# Altium project TIE_2023.PrjPcb
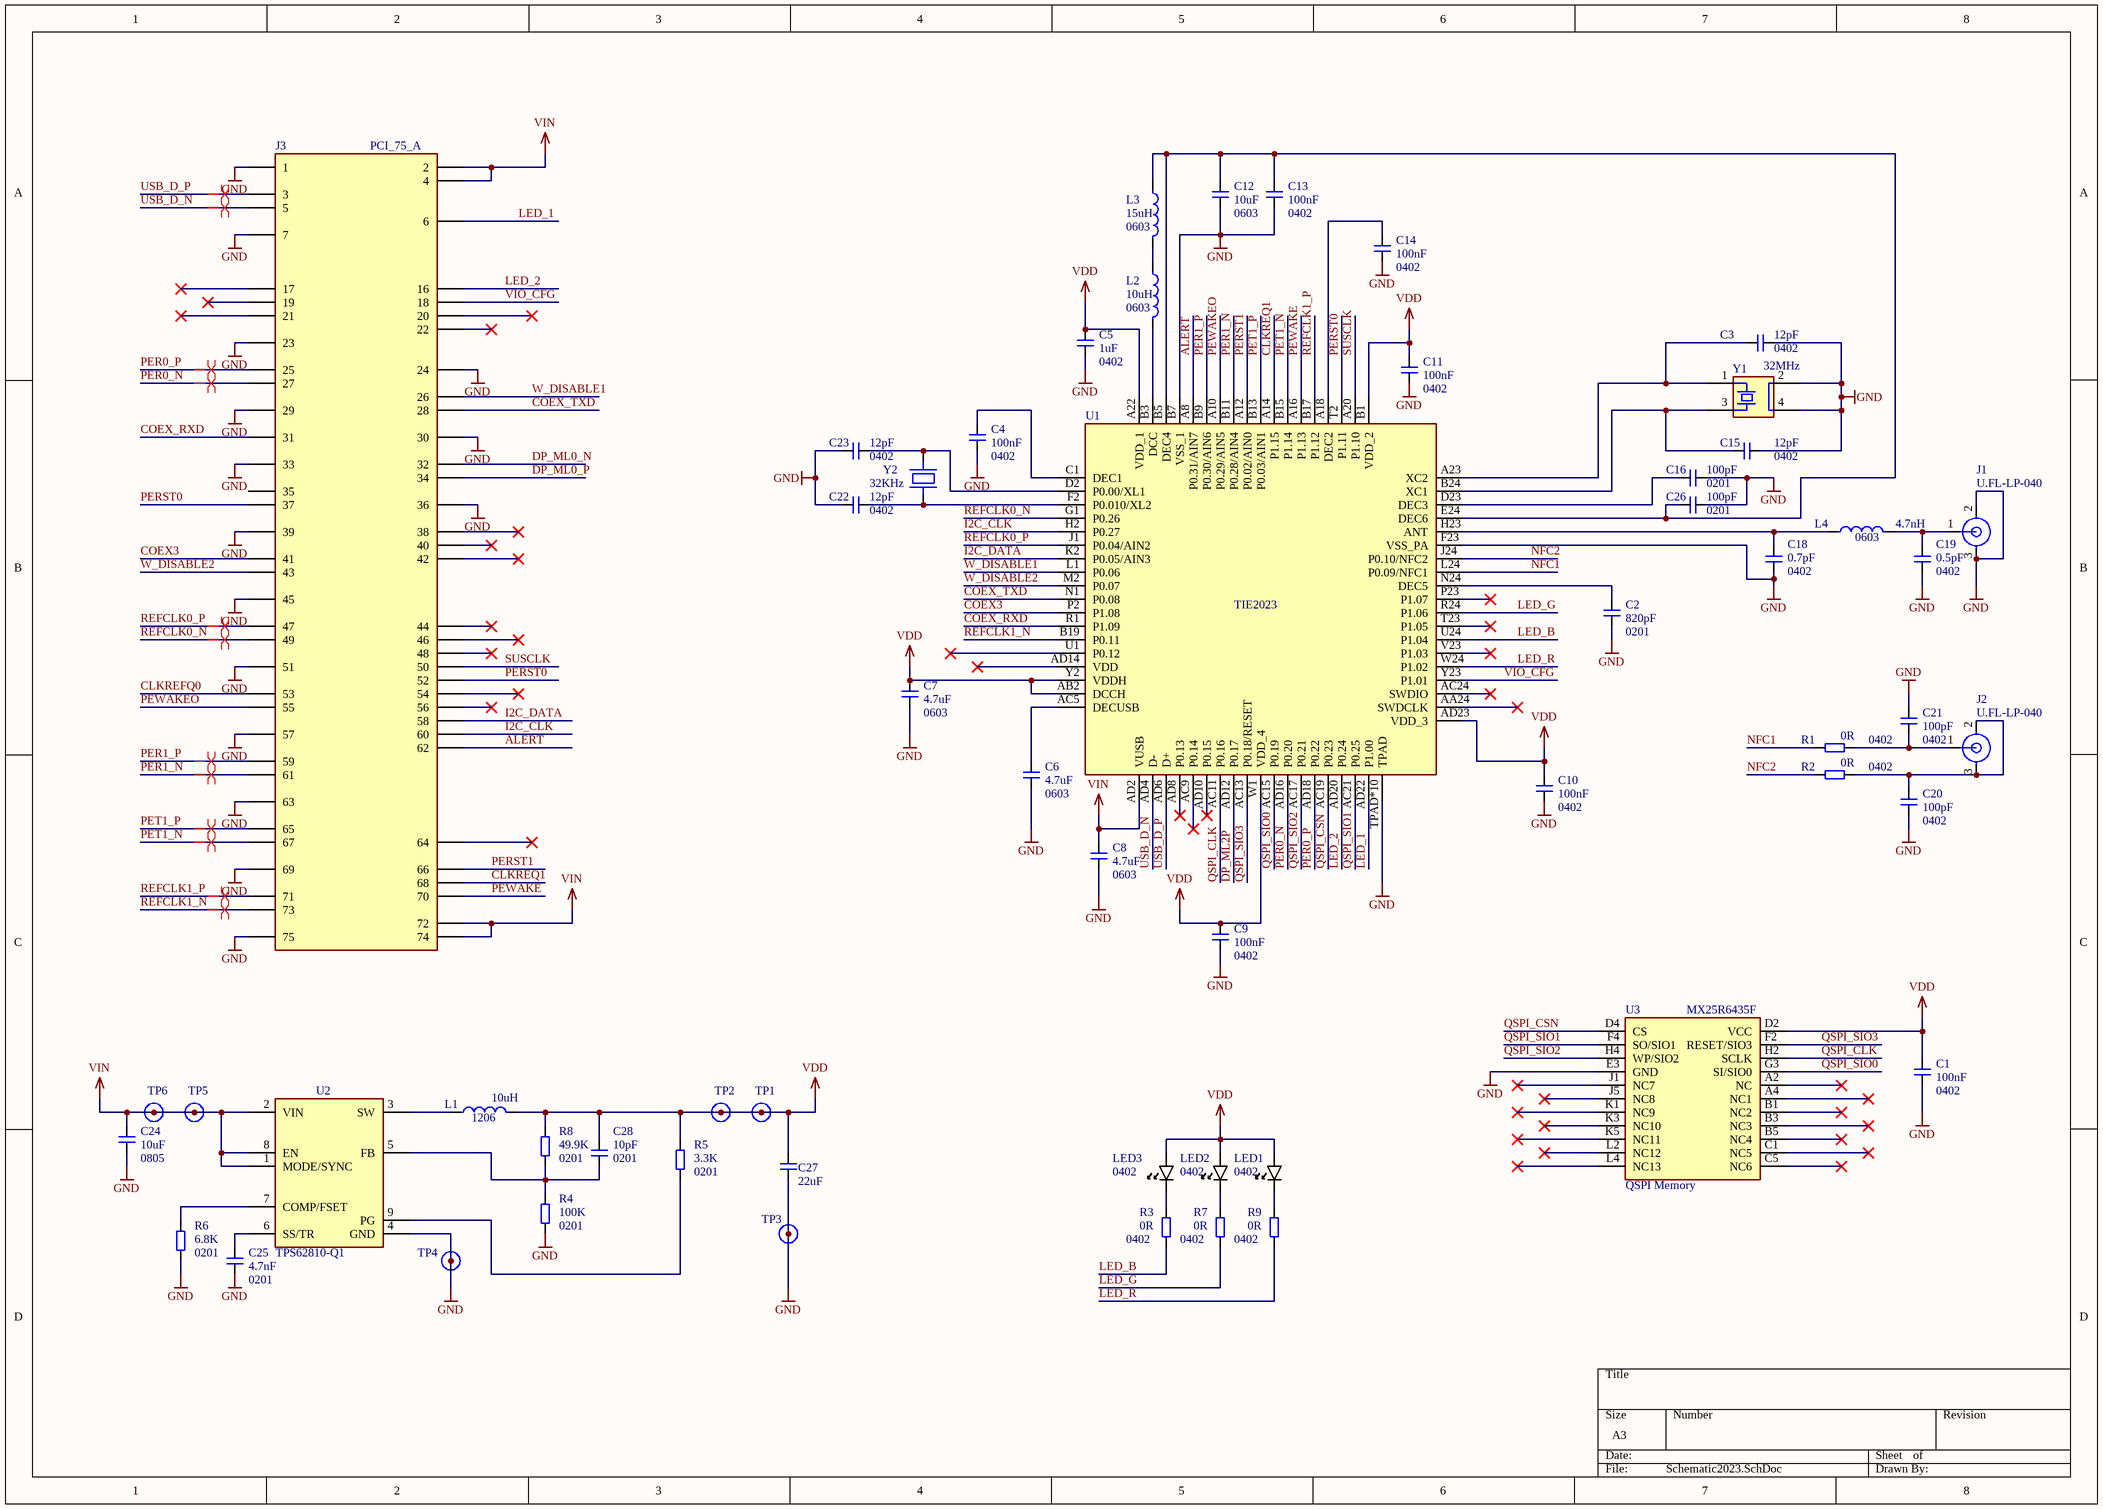
[diagram p0: Schematic2023.SchDoc]
1 sheet, 57 parts. Net scope: global (net labels, ports and power ports of the same name join across sheets).
Board file: PCB_2023.PcbDoc

## Sheet Schematic2023.SchDoc
size A3; SheetNumber: 1; SheetTotal: 1

### Parts
C1  100nF  Package: 0402  [CAP0402]
C2  820pF  Package: 0201  [CAP0201]
C3  12pF  PAckage: 0402  [CAP0402]
C4  100nF  Package: 0402  [CAP0402]
C5  1uF  Package: 0402  [CAP0402]
C6  4.7uF  Package: 0603  [CAP0603]
C7  4.7uF  Package: 0603  [CAP0603]
C8  4.7uF  Package: 0603  [CAP0603]
C9  100nF  Package: 0402  [CAP0402]
C10  100nF  Package: 0402  [CAP0402]
C11  100nF  Package: 0402  [CAP0402]
C12  10uF  Package: 0603  [CAP0603]
C13  100nF  Package: 0402  [CAP0402]
C14  100nF  Package: 0402  [CAP0402]
C15  12pF  Package: 0402  [CAP0402]
C16  100pF  Package: 0201  [CAP0201]
C18  0.7pF  Package: 0402  [CAP0402]
C19  0.5pF  Package: 0402  [CAP0402]
C20  100pF  Package: 0402  [CAP0402]
C21  100pF  Package: 0402  [CAP0402]
C22  12pF  PAckage: 0402  [CAP0402]
C23  12pF  PAckage: 0402  [CAP0402]
C24  10uF  Package: 0805  [CAP0805]
C25  4.7nF  Package: 0201  [CAP0201]
C26  100pF  Package: 0201  [CAP0201]
C27  22uF  [CAP0805]
C28  10pF  PAckage: 0201  [CAP0201]
J1  U.FL-LP-040  [U.FL-R-SMT-1]
J2  U.FL-LP-040  [U.FL-R-SMT-1]
J3  PCI_75_A  [PCI_75_a]  (no BOM)
L1  10uH  Package: 1206  [FB_1206]
L2  10uH  Package: 0603  [FB_0603]
L3  15uH  Package: 0603  [FB_0603]
L4  4.7nH  Package: 0603  [FB_0603]
LED1  Parameter 1: 0402  [LED0402]  (hidden comment: APT1608SRCPRV)
LED2  Parameter 1: 0402  [LED0402]  (hidden comment: APT1608SRCPRV)
LED3  Parameter 1: 0402  [LED0402]  (hidden comment: APT1608SRCPRV)
R1  0R  Package: 0402  [RES0402]
R2  0R  Package: 0402  [RES0402]
R3  0R  Package: 0402  [RES0402]
R4  100K  Package: 0201  [RES0201]
R5  3.3K  PAckage: 0201  [RES0201]
R6  6.8K  Package: 0201  [RES0201]
R7  0R  Package: 0402  [RES0402]
R8  49.9K  Package: 0201  [RES0201]
R9  0R  Package: 0402  [RES0402]
TP1  Testpoint  [TestPoint]  (value not drawn)  (no BOM)
TP2  Testpoint  [TestPoint]  (value not drawn)  (no BOM)
TP3  Testpoint  [TestPoint]  (value not drawn)  (no BOM)
TP4  Testpoint  [TestPoint]  (value not drawn)  (no BOM)
TP5  Testpoint  [TestPoint]  (value not drawn)  (no BOM)
TP6  Testpoint  [TestPoint]  (value not drawn)  (no BOM)
U1  TIE2023  [TIE23_IC]
U2  TPS62810-Q1  [VQFN-9]
U3  QSPI Memory  [WLCSP-22]
Y1  32MHz  [XRCGB-2X1.6]
Y2  32KHz  [CFPX-3.2X1.5]

### Nets
GND: C1.1 C2.1 C3.2 C4.1 C5.1 C6.1 C7.1 C8.1 C9.1 C10.1 C11.1 C12.1 C13.1 C14.1 C15.2 C16.2 C18.1 C19.1 C20.1 C21.2 C22.1 C23.1 C24.1 C25.1 C26.2 C27.1 J1.2 J1.3 J3.1 J3.7 J3.23 J3.24 J3.29 J3.30 J3.33 J3.36 J3.39 J3.45 J3.51 J3.57 J3.63 J3.69 J3.75 R4.1 R6.1 TP3.1 TP4.1 U1.B7(VSS_1) U1.F23(VSS_PA) U1.TPAD*10(TPAD) U2.4(GND) U3.E3(GND) Y1.2 Y1.4
VDD: C1.2 C5.2 C7.2 C9.2 C10.2 C11.2 C27.2 C28.2 L1.2 LED1.2 LED2.2 LED3.2 R5.2 R8.2 TP1.1 TP2.1 U1.A22(VDD_1) U1.AB2(DCCH) U1.AD23(VDD_3) U1.B1(VDD_2) U1.W1(VDD_4) U1.Y2(VDDH) U3.D2(VCC)
VIN: C8.2 C24.2 J3.2 J3.4 J3.72 J3.74 TP5.1 TP6.1 U1.AD2(VUSB) U2.1(MODE/SYNC) U2.2(VIN) U2.8(EN)
ALERT: J3.62 U1.A8(P0.31/AIN7)
CLKREFQ0: J3.53
CLKREQ1: J3.68 U1.A14(P1.15)
COEX3: J3.41 U1.P2(P1.08)
COEX_RXD: J3.31 U1.R1(P1.09)
COEX_TXD: J3.28 U1.N1(P0.08)
DP_ML0_N: J3.32
DP_ML0_P: J3.34
DP_ML2P: U1.AD12(P0.17)
I2C_CLK: J3.60 U1.H2(P0.27)
I2C_DATA: J3.58 U1.K2(P0.05/AIN3)
LED_1: J3.6 U1.AD22(P1.00)
LED_2: J3.16 U1.AD20(P0.24)
LED_B: R3.1 U1.U24(P1.04)
LED_G: R7.1 U1.R24(P1.06)
LED_R: R9.1 U1.W24(P1.02)
NFC1: R1.1 U1.L24(P0.09/NFC1)
NFC2: R2.1 U1.J24(P0.10/NFC2)
PER0_N: J3.27 U1.AD16(P0.20)
PER0_P: J3.25 U1.AD18(P0.22)
PER1_N: J3.61 U1.B11(P0.28/AIN4)
PER1_P: J3.59 U1.B9(P0.30/AIN6)
PERST0: J3.37 J3.52 U1.T2(P1.11)
PERST1: J3.66 U1.A12(P0.02/AIN0)
PET1_N: J3.67 U1.B15(P1.14)
PET1_P: J3.65 U1.B13(P0.03/AIN1)
PEWAKE: J3.70 U1.A16(P1.13)
PEWAKEO: J3.55 U1.A10(P0.29/AIN5)
QSPI_CLK: U1.AC11(P0.16) U3.H2(SCLK)
QSPI_CSN: U1.AC19(P0.23) U3.D4(CS)
QSPI_SIO0: U1.AC15(P0.19) U3.G3(SI/SIO0)
QSPI_SIO1: U1.AC21(P0.25) U3.F4(SO/SIO1)
QSPI_SIO2: U1.AC17(P0.21) U3.H4(WP/SIO2)
QSPI_SIO3: U1.AC13(P0.18/RESET) U3.F2(RESET/SIO3)
REFCLK0_N: J3.49 U1.G1(P0.26)
REFCLK0_P: J3.47 U1.J1(P0.04/AIN2)
REFCLK1_N: J3.73 U1.B19(P0.11)
REFCLK1_P: J3.71 U1.B17(P1.12)
SUSCLK: J3.50 U1.A20(P1.10)
USB_D_N: J3.5 U1.AD4(D-)
USB_D_P: J3.3 U1.AD6(D+)
VIO_CFG: J3.18 U1.Y23(P1.01)
W_DISABLE1: J3.26 U1.L1(P0.06)
W_DISABLE2: J3.43 U1.M2(P0.07)
NetC2_2: C2.2 U1.N24(DEC5)
NetC3_1: C3.1 U1.A23(XC2) Y1.1
NetC4_2: C4.2 U1.C1(DEC1)
NetC6_2: C6.2 U1.AC5(DECUSB)
NetC12_2: C12.2 C13.2 C26.1 L3.1 U1.B5(DEC4) U1.E24(DEC6)
NetC14_2: C14.2 U1.A18(DEC2)
NetC15_1: C15.1 U1.B24(XC1) Y1.3
NetC16_1: C16.1 U1.D23(DEC3)
NetC18_2: C18.2 L4.1 U1.H23(ANT)
NetC19_2: C19.2 J1.1 L4.2
NetC20_2: C20.2 J2.2 J2.3 R2.2
NetC21_1: C21.1 J2.1 R1.2
NetC22_2: C22.2 U1.F2(P0.010/XL2) Y2.1
NetC23_2: C23.2 U1.D2(P0.00/XL1) Y2.2
NetC25_2: C25.2 U2.6(SS/TR)
NetC28_1: C28.1 R4.2 R8.1 U2.5(FB)
NetL1_1: L1.1 U2.3(SW)
NetL2_1: L2.1 L3.2
NetL2_2: L2.2 U1.B3(DCC)
NetLED1_1: LED1.1 R9.2
NetLED2_1: LED2.1 R7.2
NetLED3_1: LED3.1 R3.2
NetR5_1: R5.1 U2.9(PG)
NetR6_2: R6.2 U2.7(COMP/FSET)

Not connected (* = marked no-connect by the designer): J3 17* 19* 20* 21* 22* 35 38* 40* 42* 44* 46* 48* 54* 56* 64*; U1 AA24(SWDCLK)* AC9(P0.14)* AC24(SWDIO)* AD8(P0.13)* AD10(P0.15)* AD14(VDD)* P23(P1.07)* T23(P1.05)* U1(P0.12)* V23(P1.03)*; U3 A2(NC)* A4(NC1)* B1(NC2)* B3(NC3)* B5(NC4)* C1(NC5)* C5(NC6)* J1(NC7)* J5(NC8)* K1(NC9)* K3(NC10)* K5(NC11)* L2(NC12)* L4(NC13)*

### Layout directives
differential pair: PER0_N, PER0_P, PER1_N, PER1_P, PET1_N, PET1_P, REFCLK0_N, REFCLK0_P, REFCLK1_N, REFCLK1_P, USB_D_N, USB_D_P

### Library data of the parts
C1 C4 C9-C11 C13 C14 = GCM155R71C224KE02J: CAP CER 100nF 16V X7R 0402; Manufacturer: Murata; Manufacturer Part Number: GCM155R71C224KE02J
C2 = GRM033C81A473ME05D_1: CAP CER 820pF 20% 10V X6S 0201; Manufacturer: Murata; .Checked_PCB: AI; Manufacturer Part Number: GRM033C81A473ME05D; .Checked_SCH: AI; .Creator: AI
C3 C15 C22 C23 = GCM155R71C224KE02J_1: CAP CER 12pF 16V X7R 0402; Manufacturer: Murata; Manufacturer Part Number: GCM155R71C224KE02J
C5 = GCM155R71C224KE02J_1uF: CAP CER 1uF 16V X7R 0402; Manufacturer: Murata; Manufacturer Part Number: GCM155R71C224KE02J
C6-C8 = GCJ188R71E105KA01D: CAP CER 4.7uF 25V X7R 0603; Manufacturer: Murata; .Checked_PCB: IC; Manufacturer Part Number: GCJ188R71E105KA01D; .Checked_SCH: IC; .Creator: IC
C12 = GCJ188R71E105KA01D_1: CAP CER 10uF 25V X7R 0603; Manufacturer: Murata; .Checked_PCB: IC; Manufacturer Part Number: GCJ188R71E105KA01D; .Checked_SCH: IC; .Creator: IC
C16 C26 = GRM033C81A473ME05D_100pF: CAP CER 100pF 20% 10V X6S 0201; Manufacturer: Murata; .Checked_PCB: AI; Manufacturer Part Number: GRM033C81A473ME05D; .Checked_SCH: AI; .Creator: AI
C18 = GCM155R71C224KE02J_0.7pF: CAP CER 0.7pF 16V X7R 0402; Manufacturer: Murata; Manufacturer Part Number: GCM155R71C224KE02J
C19 = GCM155R71C224KE02J_0.5pF: CAP CER 0.5pF 16V X7R 0402; Manufacturer: Murata; Manufacturer Part Number: GCM155R71C224KE02J
C20 C21 = GCM155R71C224KE02J_100pF: CAP CER 100pF 16V X7R 0402; Manufacturer: Murata; Manufacturer Part Number: GCM155R71C224KE02J
C24 = GCM21BR70J106KE10uF: CAP CER 10uF 10% 6.3V X7R 0805; Manufacturer: Murata; Manufacturer Part Number: GCM21BR70J106KE22K; .Checked_PCB: AI; .Checked_SCH: AI; .Creator: AI
C25 = GRM033C81A473ME05D_2: CAP CER 4.7nF 20% 10V X6S 0201; Manufacturer: Murata; .Checked_PCB: AI; Manufacturer Part Number: GRM033C81A473ME05D; .Checked_SCH: AI; .Creator: AI
C27 = GCM21BR70J106KE22K: CAP CER 22uF 10% 6.3V X7R 0805; Manufacturer: Murata; .Checked_PCB: AI; Manufacturer Part Number: GCM21BR70J106KE22K; .Checked_SCH: AI; .Creator: AI
C28 = GRM033C81A473ME05D: CAP CER 10pF 20% 10V X6S 0201; Manufacturer: Murata; .Checked_PCB: AI; Manufacturer Part Number: GRM033C81A473ME05D; .Checked_SCH: AI; .Creator: AI
J1 J2 = U.FL-LP-040: Ultra Small Surface Mount Coaxial Connectors
J3 = PCI_75_A: M2 Key A Edge Connector
L1 = IND1206: Power Inductors - SMD 0603 10uH 20%
L2 = IND0603_10uH: Power Inductors - SMD 3655 0603 4N7 +/- 0.3nH T&R
L3 = IND0603_15uH: Power Inductors - SMD 3655 0603 4N7 +/- 0.3nH T&R
L4 = IND0603: Power Inductors - SMD 3655 0603 4N7 +/- 0.3nH T&R
LED1-LED3 = APT1608SRCPRV: Standard LEDs - SMD RED WATER CLEAR; Manufacturer: Kingbright; .Checked_PCB: IC; Manufacturer Part Number: APT1608SRCPRV; .Checked_SCH: IC
R1-R3 R7 R9 = RC0402FR-07392RL: RES SMD 0 OHM 1% 1/16W 0402; Manufacturer: Yageo; Manufacturer Part Number: RC0402FR-07392RL
R4 = RC0201FR-07330RL: RES SMD 100K OHM 1% 1/20W 0201; Manufacturer: Yageo; .Checked_PCB: AI; Manufacturer Part Number: RC0201FR-07330RL; .Checked_SCH: AI; .Creator: AI
R5 = RC0201FR-073300: RES SMD 3.3KK OHM 1% 1/20W 0201; Manufacturer: Yageo; Manufacturer Part Number: RC0201FR-07330RL; .Checked_PCB: AI; .Checked_SCH: AI; .Creator: AI
R6 = RC0201FR-07330RL_2: RES SMD 6.8K OHM 1% 1/20W 0201; Manufacturer: Yageo; .Checked_PCB: AI; Manufacturer Part Number: RC0201FR-07330RL; .Checked_SCH: AI; .Creator: AI
R8 = RC0201FR-07330RL_1: RES SMD 49.9K OHM 1% 1/20W 0201; Manufacturer: Yageo; .Checked_PCB: AI; Manufacturer Part Number: RC0201FR-07330RL; .Checked_SCH: AI; .Creator: AI
TP1-TP6 = Testpoint: • SMD Pad diameter of 1mm. / • Solder mask opening = 0.075mm from pad edge;
U1 = TIE2023: Bluetooth, NFC and ANT+ IC
U2 = TPS62810-Q1: Switching Voltage Regulators Automotive 2.75-V to 6-V 4-A step-down
U3 = MX25R6435F: NOR Flash Serial NOR 1.65V-3.6V 64Mbit x4 I/O WLCSP-22; Package: MX25R6435F
Y1 = XRCGB30: A 2 x 1.6mm SMD crystal in a ceramic package
Y2 = CFPX-217: A 3.2 x 1.5mm SMD crystal in a ceramic package with a seam / sealed metal lid, hermetically sealed